# Altium schematic sheet MainGame.SchDoc
size A4
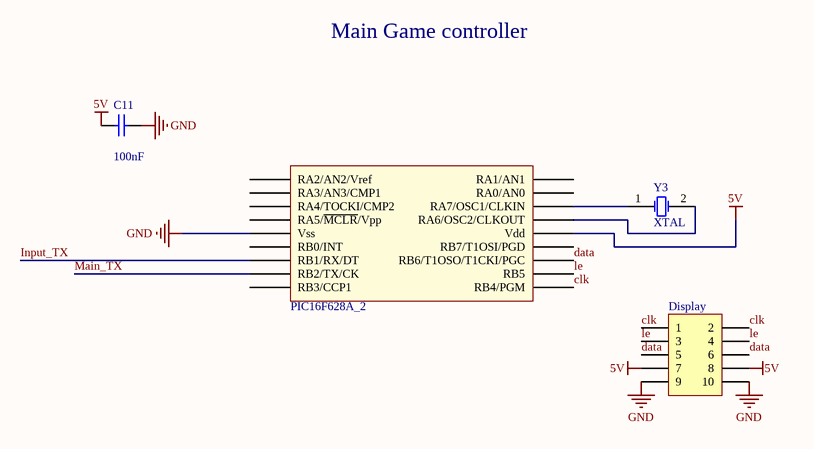
[diagram p0: MainGame.SchDoc]

## Parts
C11  value 100nF  [CeramicalCapacitor]  (hidden comment: Cap)
Display  Header 5X2  [DisplayConnector]  (value not drawn)
PIC16F628A_2  Microcontroller  [DIP18]  (value not drawn)
Y3  XTAL  [Kristal]

## Nets
5V: C11.1 Display.7 Display.8 PIC16F628A_2.14(Vdd)
GND: C11.2 Display.9 Display.10 PIC16F628A_2.5(Vss)
clk: Display.1 Display.2 PIC16F628A_2.10(RB4/PGM)
data: Display.5 Display.6 PIC16F628A_2.12(RB6/T1OSO/T1CKI/PGC)
Input_TX: PIC16F628A_2.7(RB1/RX/DT)
le: Display.3 Display.4 PIC16F628A_2.11(RB5)
Main_TX: PIC16F628A_2.8(RB2/TX/CK)
NetPIC16F628A_2_15: PIC16F628A_2.15(RA6/OSC2/CLKOUT) Y3.2(OSC2)
NetPIC16F628A_2_16: PIC16F628A_2.16(RA7/OSC1/CLKIN) Y3.1(OSC1)

Not connected (* = marked no-connect by the designer): PIC16F628A_2 1(RA2/AN2/Vref) 2(RA3/AN3/CMP1) 3(RA4/TOCKI/CMP2) 4(RA5/~{MCLR}/Vpp) 6(RB0/INT) 9(RB3/CCP1) 13(RB7/T1OSI/PGD) 17(RA0/AN0) 18(RA1/AN1)

## Notes on the sheet
- Main Game controller

## Library data of the parts
C11 = Cap: Capacitor; Published: 8-Jun-2000; LatestRevisionDate: 17-Jul-2002; LatestRevisionNote: Re-released for DXP Platform.; PackageReference: RAD-0.3; Publisher: Altium Limited; PackageDescription: Radial Cap, Thru-Hole; 2 Leads; 0.3 in Pin Spacing
Display = Header 5X2: Header, 5-Pin, Dual row; LatestRevisionDate: 17-Jul-2002; LatestRevisionNote: Re-released for DXP Platform.; Publisher: Altium Limited
PIC16F628A_2 = PIC16F628A: Microcontroller PIC16F628A
Y3 = XTAL: Crystal Oscillator; Published: 8-Jun-2000; LatestRevisionDate: 17-Jul-2002; LatestRevisionNote: Re-released for DXP Platform.; PackageReference: R38; Publisher: Altium Limited; PackageDescription: Crystal, Thru-Hole; 2 Leads; Body 3.1 x 8.2 mm (Dia.xH)